# Altium schematic sheet MCU.SchDoc
size A4; SheetNumber: 5; SheetTotal: 6
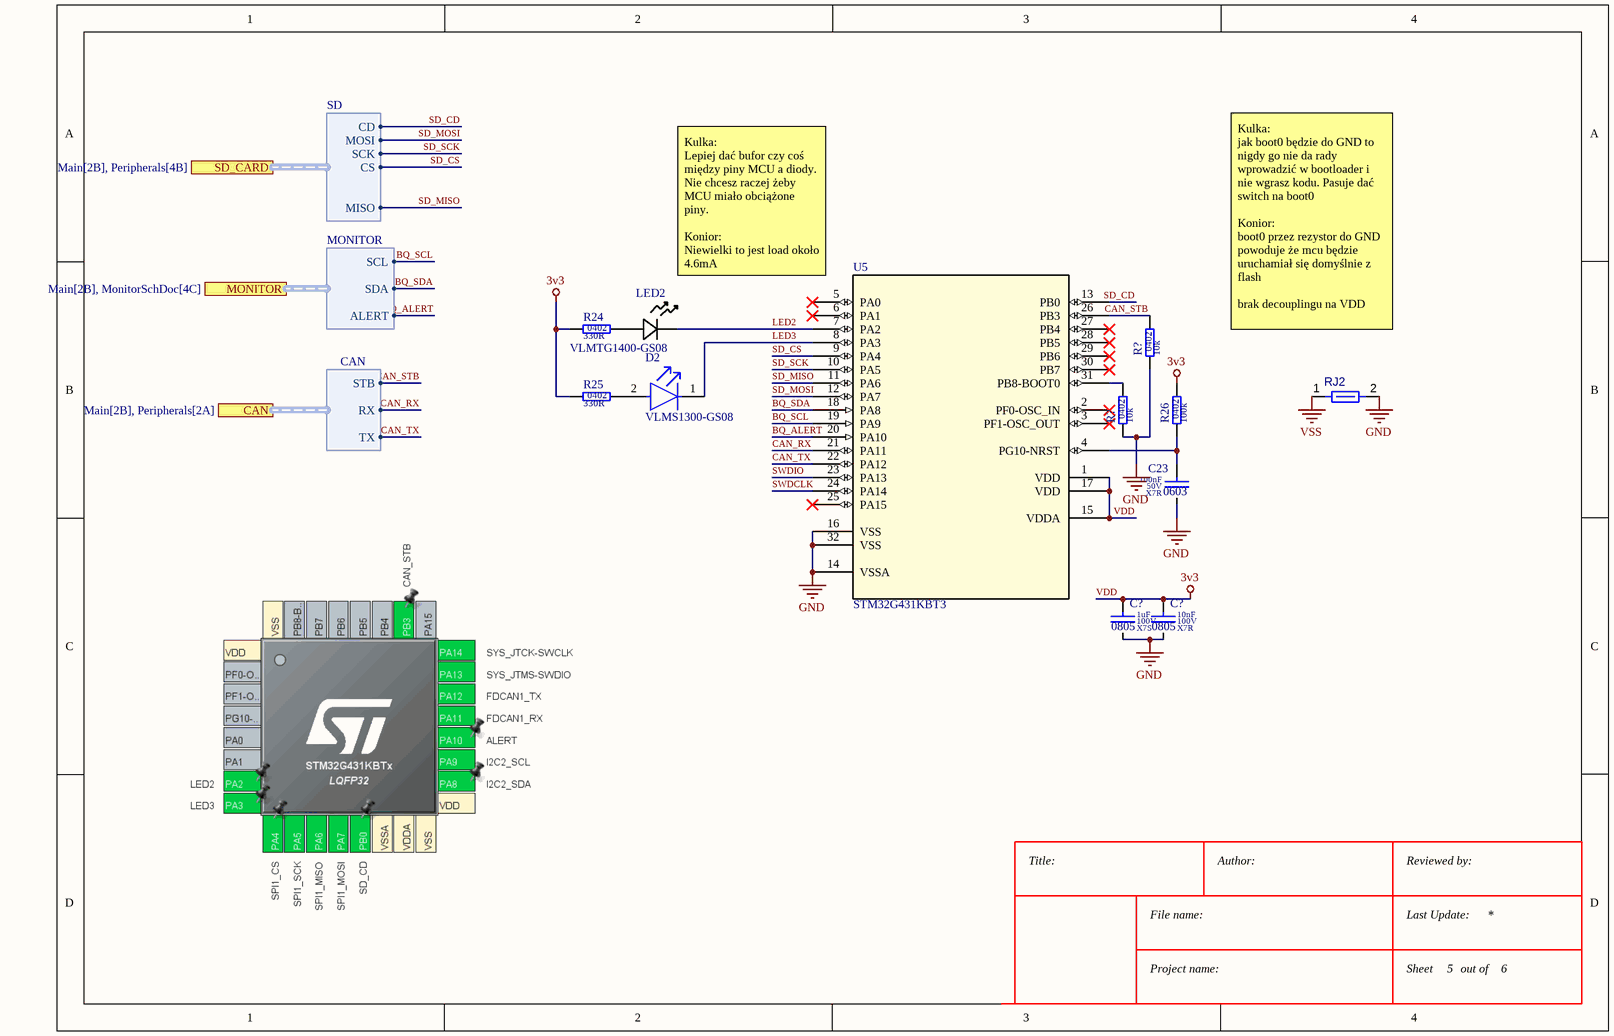
[diagram p0: MCU.SchDoc]

## Parts
(Parts that share a designator on the sheet are numbered #1, #2 ... from top to bottom, then left to right.)
C23  value 100nF  Dielectric: X7R  Voltage: 50V  SCH_Footprint: 0603  [C_0603_1608]  (hidden comment: Ceramic X7R)
C?#1  value 1uF  Dielectric: X7S  Voltage: 100V  SCH_Footprint: 0805  [C_0805_2012]  (hidden comment: Ceramic X7S)
C?#2  value 10nF  Dielectric: X7R  Voltage: 100V  SCH_Footprint: 0805  [C_0805_2012]  (hidden comment: Ceramic X7R)
D2  VLMS1300-GS08  [FP-6_541-5092_01-4-MFG]
LED2  VLMTG1400-GS08  [LED_400-GS08_VIS]
R24  value 330R  SCH_Footprint: 0402  [R_0402_1005]  (hidden comment: Resistor)
R25  value 330R  SCH_Footprint: 0402  [R_0402_1005]  (hidden comment: Resistor)
R26  value 100k  SCH_Footprint: 0402  [R_0402_1005]  (hidden comment: Resistor)
R?#1  value 10k  SCH_Footprint: 0402  [R_0402_1005]  (hidden comment: Resistor)
R?#2  value 10k  SCH_Footprint: 0402  [R_0402_1005]  (hidden comment: Resistor)
RJ2  Net Tie 12x8mil  [SHORT06-FP]  (value not drawn)  (net tie, no BOM)
U5  STM32G431KBT3  [LQFP-32_STM]

## Ports
CAN (harness CAN, see Main[2B], Peripherals[2A]), MONITOR (harness MONITOR, see Main[2B], MonitorSchDoc[4C]), SD_CARD (harness SD, see Main[2B], Peripherals[4B])

## Harnesses
SD: MISO, SCK, MOSI, CD, CS
MONITOR: SDA, ALERT, SCL
CAN: TX, RX, STB

## Nets
GND: C23.2 C?#1.2 C?#2.2 R?#1.1 R?#2.1 RJ2.2 U5.14(VSSA) U5.16(VSS) U5.32(VSS)
VDD: C?#1.1 C?#2.1 R24.1 R25.1 R26.2 U5.1(VDD) U5.15(VDDA) U5.17(VDD)  [also labelled 3v3]
VSS: RJ2.1
BQ_ALERT: U5.20(PA10) ; port MONITOR.ALERT
BQ_SCL: U5.19(PA9) ; port MONITOR.SCL
BQ_SDA: U5.18(PA8) ; port MONITOR.SDA
CAN_RX: U5.21(PA11) ; port CAN.RX
CAN_STB: R?#1.2 U5.26(PB3) ; port CAN.STB
CAN_TX: U5.22(PA12) ; port CAN.TX
LED2: LED2.1 U5.7(PA2)
LED3: D2.1(C) U5.8(PA3)
SD_CD: U5.13(PB0) ; port SD_CARD.CD
SD_CS: U5.9(PA4) ; port SD_CARD.CS
SD_MISO: U5.11(PA6) ; port SD_CARD.MISO
SD_MOSI: U5.12(PA7) ; port SD_CARD.MOSI
SD_SCK: U5.10(PA5) ; port SD_CARD.SCK
SWDCLK: U5.24(PA14)
SWDIO: U5.23(PA13)
NetC23_1: C23.1 R26.1 U5.4(PG10-NRST)
NetD2_2: D2.2(A) R25.2
NetLED2_2: LED2.2 R24.2
NetR?#2_2: R?#2.2 U5.31(PB8-BOOT0)

Not connected (* = marked no-connect by the designer): U5 2(PF0-OSC_IN)* 3(PF1-OSC_OUT)* 5(PA0)* 6(PA1)* 25(PA15)* 27(PB4)* 28(PB5)* 29(PB6)* 30(PB7)*

## Notes on the sheet
- Kulka:
  Lepiej dać bufor czy coś między piny MCU a diody. Nie chcesz raczej żeby MCU miało obciążone piny.
  Konior:
  Niewielki to jest load około 4.6mA
- Kulka:
  jak boot0 będzie do GND to nigdy go nie da rady wprowadzić w bootloader i nie wgrasz kodu. Pasuje dać switch na boot0
  Konior:
  boot0 przez rezystor do GND powoduje że mcu będzie uruchamiał się domyślnie z flash
  brak decouplingu na VDD
- Title:
- File name:
- Author:
- Reviewed by:
- Last Update:
- Project name:
- Sheet
- out of

## Library data of the parts
C23 = C_100nF_50V_X7R_0603_10_AECQ1: Capacitor; Manufacturer: Murata; Manufacturer Part Number: GCM188R71H104KA57D; Tolerance (%): 10; AEC-Q: 1; Part Number: C_100nF_50V_X7R_0603_10_AECQ1; HelpURL: https://www.murata.com/products/productdetail?partno=GCM188R71H104KA57%23; Supplier 1: TME; Supplier Part Number 1: GCM188R71H104KA57D; Supplier 2: RS Components; Supplier 3: Farnell; Supplier Part Number 3: 4360223; Supplier 4: Mouser; Supplier Part Number 4: 81-GCM188R71H104KA7D; Supplier 5: Digi-Key; Supplier Part Number 5: 490-4779-1-ND; Supplier 6: LCSC; Supplier Part Number 6: C85864
C?#1 = C_1uF_100V_X7S_0805_10_AECQ1: Capacitor; Manufacturer: Murata; Manufacturer Part Number: GCM21BC72A105KE36; Tolerance (%): 10; AEC-Q: 1; Part Number: C_1uF_100V_X7S_0805_10_AECQ1; HelpURL: https://www.murata.com/products/productdetail?partno=GCM21BC72A105KE36%23; Supplier 1: TME; Supplier Part Number 1: GCM21BC72A105KE36L; Supplier 2: RS Components; Supplier 3: Farnell; Supplier Part Number 3: 3243166; Supplier 4: Mouser; Supplier Part Number 4: 81-GCM21BC72A105KE6L; Supplier 5: Digi-Key; Supplier Part Number 5: 490-14436-1-ND; Supplier 6: LCSC; Supplier Part Number 6: C126585
C?#2 = C_10nF_100V_X7R_0805_10_AECQ1: Capacitor; Manufacturer: Murata; Manufacturer Part Number: GCM216R72A103KA37D; Tolerance (%): 10; AEC-Q: 1; Part Number: C_10nF_100V_X7R_0805_10_AECQ1; HelpURL: https://www.murata.com/products/productdetail?partno=GCM216R72A103KA37%23; Supplier 1: TME; Supplier Part Number 1: GCM216R72A103KA37D; Supplier 2: RS Components; Supplier 3: Farnell; Supplier Part Number 3: 4326631; Supplier 4: Mouser; Supplier Part Number 4: 81-GCM216R72A103KA7D; Supplier 5: Digi-Key; Supplier Part Number 5: 490-6060-1-ND; Supplier 6: LCSC; Supplier Part Number 6: C469523
D2 = CMP-02520-000012-1: LED RED 0603 SMD; Manufacturer: Vishay; Forward Voltage: 2V; Reverse Voltage: 5V; Power Dissipation: 75mW; Forward Current: 20mA; Luminous Intensity: 54mcd; Led Orientation: Top View; Peak Emmision Wavelength: 639nm; Viewing Angle: 130°; Wavelength: 631nm; Digikey Description: LED RED 0603 SMD; Height: 1mm; Colour: Red; Ambient Temperature Range High: +85°C; Ambient Temperature Range Low: -35°C; Package: 6.541-5092.01-4; Automotive: No; Temperature Range High: +85°C; Device Class L3: unset; Lead Free: Yes; Temperature Range Low: -35°C; Temperature: -35°C to +85°C; Manufacturer Part Number: VLMS1300-GS08; Device Class L2: LEDs; ComponentLink2Description: Datasheet; Octopart: https://octopart.com/vlms1300-gs08-vishay-21709201; Device Class L1: Optoelectronics; RoHS: TRUE; ComponentLink2URL: http://www.vishay.com/docs/82437/vlmo1300.pdf; Mouser Description: Standard LEDs - SMD Super Red Clear Non-Diff; Category: Diode
LED2 = VLMTG1400-GS08: CHIPLED (0603) TRUEGREEN HIGHBRIGHT -e4; Manufacturer_Name: Vishay; Copyright: Copyright (C) 2025 Ultra Librarian. All rights reserved.; Manufacturer_Part_Number: VLMTG1400-GS08
R24 R25 = R_330R_0402_1_AECQ0: Manufacturer: Panasonic; Manufacturer Part Number: ERJ-2RKF3300X; Voltage: 50V; Power: 100mW; Tolerance: 1%; AEC-Q: 0; Part Number: R_330R_0402_1_AECQ0; HelpURL: https://industrial.panasonic.com/cdbs/www-data/pdf/RDA0000/AOA0000C304.pdf; Supplier 1: TME; Supplier Part Number 1: ERJ2RKF3300X; Supplier 2: RS Components; Supplier 3: Farnell; Supplier Part Number 3: 2302581; Supplier 4: Mouser; Supplier Part Number 4: 667-ERJ-2RKF3300X; Supplier 5: Digi-Key; Supplier Part Number 5: P330LCT-ND; Supplier 6: LCSC
R26 = R_100k_0402_1: Manufacturer: Yageo; Manufacturer Part Number: RC0402FR-07100KL; Voltage: 50V; Power: 63mW; Tolerance: 1%; Part Number: R_100k_0402_1; HelpURL: http://www.tme.eu/pl/Document/1a2bc76e2be68b3b1670068306778ce6/rc0402yageo.pdf; Supplier 1: TME; Supplier Part Number 1: RC0402FR-07100K; Supplier 2: RS Components; Supplier 3: Farnell; Supplier Part Number 3: 2131798; Supplier 4: Mouser; Supplier Part Number 4: 603-RC0402FR-07100KL; Supplier 5: Digi-Key; Supplier Part Number 5: 311-100KLRCT-ND; Supplier 6: LCSC
R?#1 R?#2 = R_10k_0402_1: Manufacturer: Yageo; Manufacturer Part Number: RC0402FR-0710KL; Voltage: 50V; Power: 63mW; Tolerance: 1%; Part Number: R_10k_0402_1; HelpURL: http://www.tme.eu/pl/Document/1a2bc76e2be68b3b1670068306778ce6/rc0402yageo.pdf; Supplier 1: TME; Supplier Part Number 1: RC0402FR-0710K; Supplier 2: RS Components; Supplier 3: Farnell; Supplier 4: Mouser; Supplier 5: Digi-Key; Supplier 6: LCSC
RJ2 = CMP-009-00121-2: Max Operating Temperature: 155°C; Pins: 2; Min Operating Temperature: -55°C
U5 = STM32G431KBT3: Mainstream Arm Cortex-M4 MCU 170 MHz with 128 Kbytes of Flash memory, Math Accelerator, Medium Analog level integration; Manufacturer_Name: STMicroelectronics; Copyright: Copyright (C) 2026 Ultra Librarian. All rights reserved.; Manufacturer_Part_Number: STM32G431KBT3; Datasheet: https://www.st.com/resource/en/datasheet/stm32g431c6.pdf; RefDes: RefDes; Type: Type